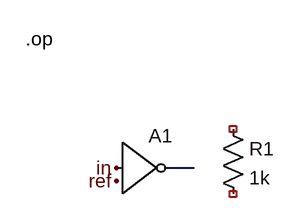
[diagram p0: schematic floating.asc]
floating.asc, the LTspice schematic file:
Version 4
SHEET 1 800 600
FLAG 128 192 in
FLAG 128 208 ref
WIRE 192 192 224 192
SYMBOL Digital\\inv 128 128 R0
SYMATTR InstName A1
SYMBOL res 256 128 R0
SYMATTR InstName R1
SYMATTR Value 1k
TEXT 16 32 Left 2 !.op

The netlist it stands for:
* floating.asc
A1 in ref ref ref ref N001 ref ref BUF
R1 NC_01 NC_02 1k
.op
.backanno
.end